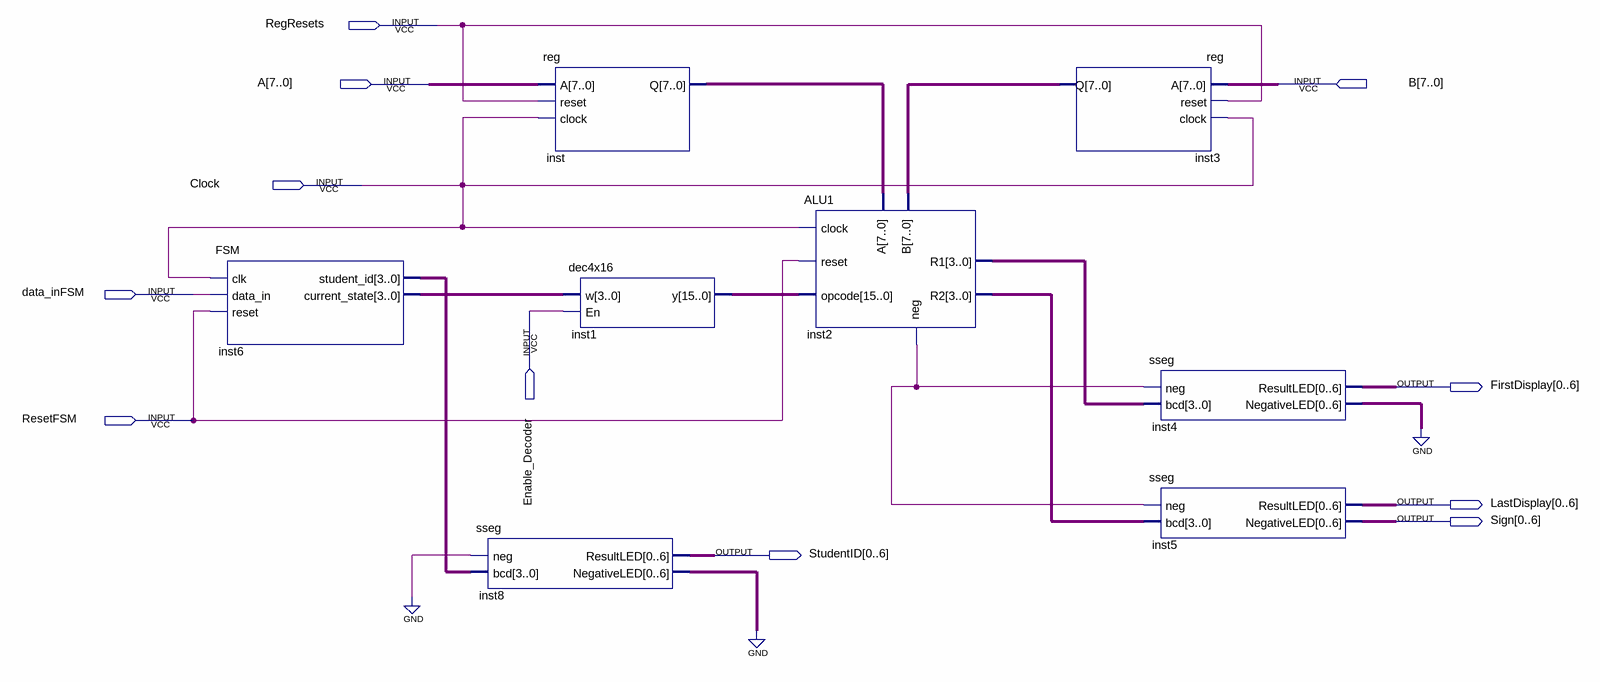
[diagram p0: schematic sheet]
// Quartus schematic GPU.bdf as structural Verilog: 8 symbols, 11 pins
module GPU (
  input  RegResets,
  input  [7:0] A,
  input  [7:0] B,
  input  Clock,
  input  data_inFSM,
  input  Enable_Decoder,
  input  ResetFSM,
  output [0:6] FirstDisplay,
  output [0:6] LastDisplay,
  output [0:6] Sign,
  output [0:6] StudentID
);

  wire inst2_neg;
  wire [3:0] inst2_r1, inst2_r2, inst6_current_state, inst6_student_id;
  wire [6:0] inst4_negativeled, inst8_negativeled;
  wire [7:0] inst3_q, inst_q;
  wire [15:0] inst1_y;

  FSM inst6 (
    .clk(Clock), .data_in(data_inFSM), .reset(ResetFSM), .student_id(inst6_student_id),
    .current_state(inst6_current_state));
  sseg inst8 (.neg(1'b0), .bcd(inst6_student_id), .ResultLED(StudentID), .NegativeLED(inst8_negativeled));
  \reg  inst (.A(A), .reset(RegResets), .clock(Clock), .Q(inst_q));
  dec4x16 inst1 (.w(inst6_current_state), .En(Enable_Decoder), .y(inst1_y));
  ALU1 inst2 (
    .clock(Clock), .reset(ResetFSM), .A(inst_q), .B(inst3_q), .opcode(inst1_y), .neg(inst2_neg),
    .R1(inst2_r1), .R2(inst2_r2));
  \reg  inst3 (.A(B), .reset(RegResets), .clock(Clock), .Q(inst3_q));
  sseg inst4 (.neg(inst2_neg), .bcd(inst2_r1), .ResultLED(FirstDisplay), .NegativeLED(inst4_negativeled));
  sseg inst5 (.neg(inst2_neg), .bcd(inst2_r2), .ResultLED(LastDisplay), .NegativeLED(Sign));
  // also tied to GND on the sheet: {inst8_negativeled[0], inst8_negativeled[1], inst8_negativeled[2], inst8_negativeled[3], inst8_negativeled[4], inst8_negativeled[5], inst8_negativeled[6], inst4_negativeled[0], inst4_negativeled[1], inst4_negativeled[2], inst4_negativeled[3], inst4_negativeled[4], inst4_negativeled[5], inst4_negativeled[6]}
endmodule
